# Altium schematic sheet Test Power Module Schematic.SchDoc
size A4; SheetNumber: 1; SheetTotal: 1
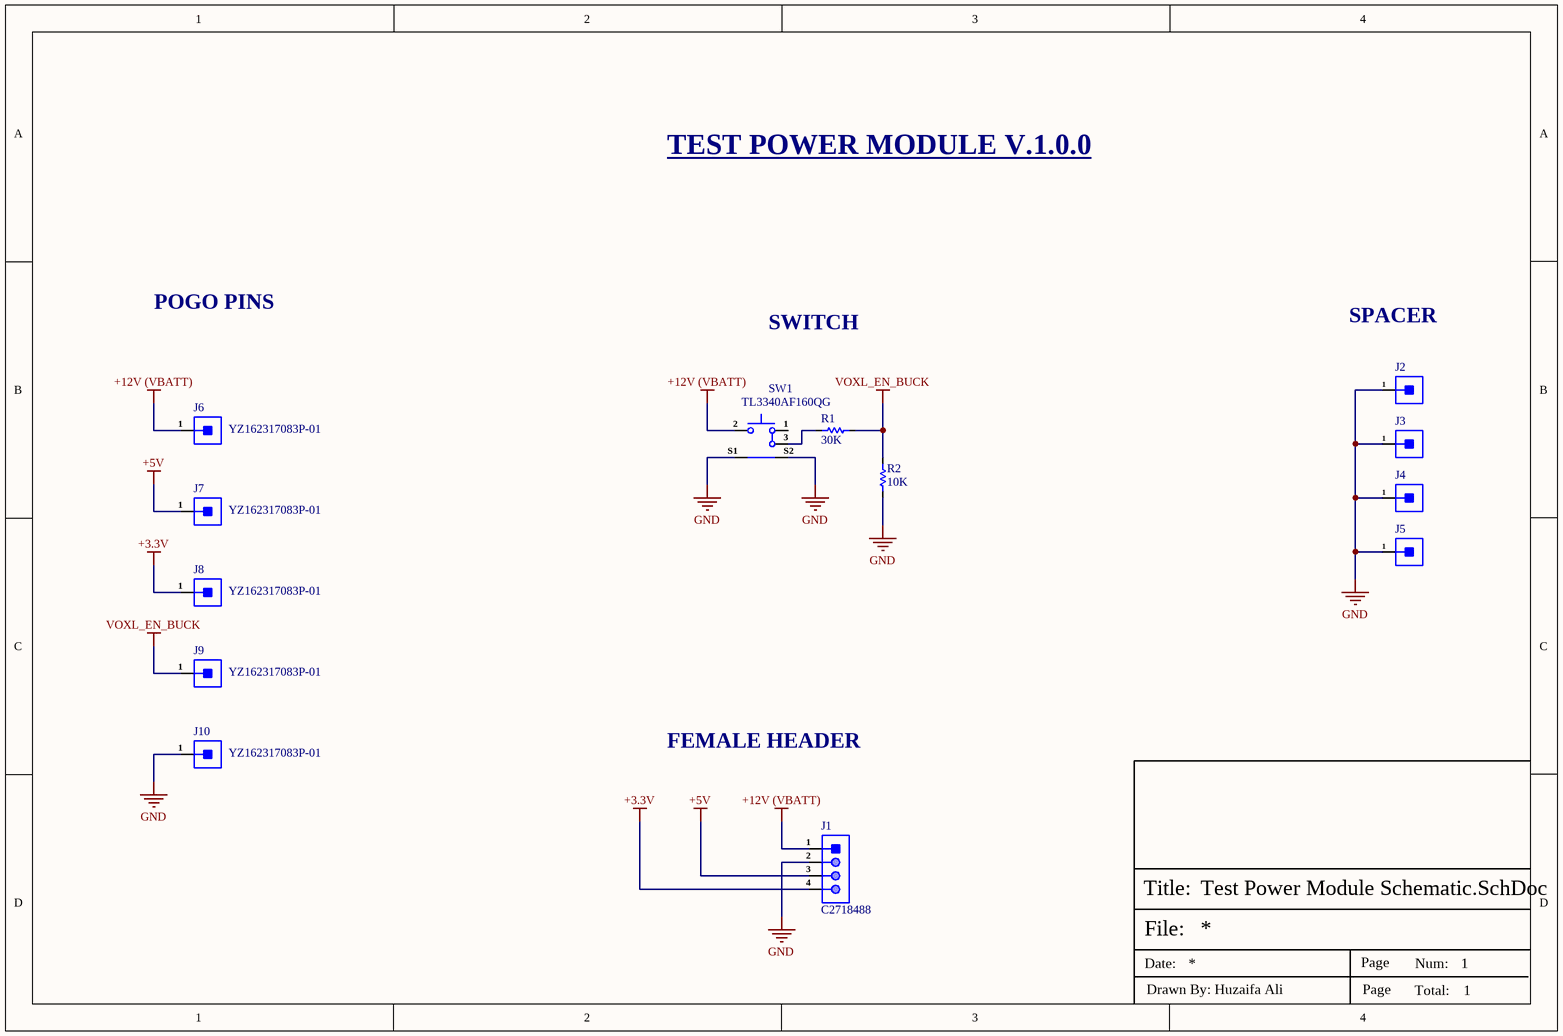
[diagram p0: Test Power Module Schematic.SchDoc]

## Parts
J1  C2718488  [HDR1X4 Female]
J2  9774050151R  [Spacer]  (value not drawn)
J3  9774050151R  [Spacer]  (value not drawn)
J4  9774050151R  [Spacer]  (value not drawn)
J5  9774050151R  [Spacer]  (value not drawn)
J6  YZ162317083P-01  [YZ162317083P-01]
J7  YZ162317083P-01  [YZ162317083P-01]
J8  YZ162317083P-01  [YZ162317083P-01]
J9  YZ162317083P-01  [YZ162317083P-01]
J10  YZ162317083P-01  [YZ162317083P-01]
R1  30K  [Res-0603]
R2  10K  [Res-0603]
SW1  TL3340AF160QG  [TL3340AF160QG]

## Nets
+3.3V: J1.4 J8.1
+5V: J1.3 J7.1
+12V (VBATT): J1.1 J6.1 SW1.2
GND: J1.2 J2.1 J3.1 J4.1 J5.1 J10.1 R2.1 SW1.S1 SW1.S2
VOXL_EN_BUCK: J9.1 R1.1 R2.2
NetR1_2: R1.2 SW1.3

Not connected (* = marked no-connect by the designer): SW1 1

## Notes on the sheet
- TEST POWER MODULE V.1.0.0
- POGO PINS
- SWITCH
- SPACER
- FEMALE HEADER
- File:
- Title:
- Date:
- Page
- Num:
- Total:
- Drawn By: Huzaifa Ali

## Library data of the parts
J1 = C2718488: 2.54mm Plugin 3A bronze -40℃~+105℃ Straight 1x4P Top 4 Square Holes Plugin,P=2.54mm Female Headers ROHS; Manufacturer: BOOMELE; Item Type: Header; Manufacturer Part Number: C2718488; Package: Plugin,P=2.54mm; LCSC Part Number: C2718488; ComponentLink1Description: LCSC; ComponentLink1URL: https://www.lcsc.com/product-detail/Female-Headers_BOOMELE-Boom-Precision-Elec-C2718488_C2718488.html
J2-J5 = 9774050151R: Spacer Material: Steel Mounting: SMT Series: WA-SMSI Thread D: M2.5; Manufacturer: Wurth Electronics; Plating: Tin; Threaded/Unthreaded: Threaded; Outside Diameter: 0.201inch; Supplier: Digikey; Supplier Part Number: 732-7095-1-ND; Manufacturer Part Number: 9774050151R; RoHS: Yes; Category: Spacers, Standoffs; Stock: 39400; Pricing: 1=1.16, 10=1.098, 50=0.979, 100=0.895 (USD); Material: Steel; Min Operating Temperature: -55°C; Max Operating Temperature: 150°C; Series: WA-SMSI; Packaging: 10Packaging; Length: 0.252inch; Height: 5.1mm; Reach SVHC Compliant: Unknown; ComponentLink1URL: http://www.farnell.com/datasheets/1960373.pdf?src-supplier=Farnell; ComponentLink1Description: http://www.farnell.com/datasheets/1960373.pdf?src-supplier=Farnell; ComponentLink2URL: http://www.mouser.com/ds/2/445/9774050151R-611428.pdf?src-supplier=Mouser; ComponentLink2Description: http://www.mouser.com/ds/2/445/9774050151R-611428.pdf?src-supplier=Mouser; ComponentLink3URL: https://media.digikey.com/pdf/Data%20Sheets/Wurth%20Electronics%20PDFs/WA-SMSx_Performance_Flyer.pdf?src-supplier=Digikey; ComponentLink3Description: https://media.digikey.com/pdf/Data%20Sheets/Wurth%20Electronics%20PDFs/WA-SMSx_Performance_Flyer.pdf?src-supplier=Digikey; ComponentLink4URL: http://www.farnell.com/datasheets/1960373.pdf?src-supplier=Element14; ComponentLink4Description: http://www.farnell.com/datasheets/1960373.pdf?src-supplier=Element14; ComponentLink5URL: https://datasheet.octopart.com/9774050151R-W%C3%BCrth-Elektronik-datasheet-48588545.pdf?src-supplier=Element14; ComponentLink5Description: https://datasheet.octopart.com/9774050151R-W%C3%BCrth-Elektronik-datasheet-48588545.pdf?src-supplier=Element14; ComponentLink6URL: http://www.farnell.com/datasheets/1960373.pdf?src-supplier=Newark; ComponentLink6Description: http://www.farnell.com/datasheets/1960373.pdf?src-supplier=Newark; ComponentLink7URL: https://katalog.we-online.de/em/datasheet/9774050151R.pdf?src-supplier=Digikey; ComponentLink7Description: https://katalog.we-online.de/em/datasheet/9774050151R.pdf?src-supplier=Digikey; Item Type: Spacer
J6-J10 = YZ162317083P-01: Brass 12V -40℃~+85℃ 单PINBit 弹簧顶针(POGO PIN) 8.3mm 50mΩ 10000次 4.28mm 2A Gold - Pogo Pin Spring Probe Connector ROHS; Manufacturer: Xinyangze; Manufacturer Part Number: YZ162317083P-01; Package: -; LCSC Part Number: C5157268; Item Type: Pogo Pin Spring Probe Connector; ComponentLink1Description: LCSC; ComponentLink1URL: https://www.lcsc.com/product-detail/Pogo-Pin-Spring-Probe-Connector_Xinyangze-YZ162317083P-01_C5157268.html
R1 = RC0603FR-0730KL: RES 30K OHM 1% 1/10W 0603; Supplier 1: Digi-Key; Supplier Part Number 1: 311-30.0KHRCT-ND; LCSC Part Number: C100001
R2 = RT0603BRD0710KL: RES SMD 10K OHM 0.1% 1/10W 0603; Manufacturer: Yageo; Power: 100mW; Rated Temperature: 70°C; Value: 10kR; Temperature Coefficient: 25ppm/°C; Working Voltage: 75V; Package Height: 0.45mm; Package Length: 1.6mm; Package Width: 0.8mm; Item Type: Resistor; Supplier 1: Rs; Manufacturer Part Number: RT0603BRD0710KL; RoHS: Yes; Category: Chip SMD Resistors; Stock 1: 20510; Pricing 1: 100=0.29800, 250=0.27800, 500=0.25900, 1000=0.23700 (GBP); Mounting Technology: Surface Mount; Pins: 2; Case/Package: 0603; Min Operating Temperature: -55°C; Max Operating Temperature: 155°C; Tolerance: 0.1%; Resistor Type: FIXED RESISTOR; Construction: Chip; Package Style: SMTMeter; Packaging: Tape and Reel; Technology: THIN FILM; Termination: Wraparound; Reach SVHC Compliant: Yes; RoHS Compliant: Yes; ComponentLink1URL: https://datasheet.ciiva.com:443/pdfs/VipMasterIC/IC/YAGO/YAGO-S-A0008510989/YAGO-S-A0008510989-1.pdf?src-supplier=IHS+Markit; ComponentLink1Description: https://datasheet.ciiva.com:443/pdfs/VipMasterIC/IC/YAGO/YAGO-S-A0008510989/YAGO-S-A0008510989-1.pdf?src-supplier=IHS+Markit; ComponentLink2URL: https://datasheet.ciiva.com/5624/pyu-rt-1-to-0-05-rohs-l-4-5624351.pdf?src-supplier=Mouser; ComponentLink2Description: https://datasheet.ciiva.com/5624/pyu-rt-1-to-0-05-rohs-l-4-5624351.pdf?src-supplier=Mouser; ComponentLink3URL: https://datasheet.ciiva.com/29721/pyu-rt-1-to-0-05-rohs-l-4-29721177.pdf?src-supplier=Digi-Key; ComponentLink3Description: https://datasheet.ciiva.com/29721/pyu-rt-1-to-0-05-rohs-l-4-29721177.pdf?src-supplier=Digi-Key; Supplier Part Number 1: 1991391P; LCSC Part Number: C95204
SW1 = TL3340AF160QG: SWITCH TACTILE SPST-NO 0.05A 12V; Manufacturer: E-Switch; Mechanical Life: 100000Cycles; Actuator Material: Polyphthalamide; Contact Current Rating: 50mA; Number of Positions: 2NUMBER; Operating Force: 160gf; Throw Configuration: SPST; Contact Resistance: 500mR; Illumination Type: Non-Illuminated,Illuminated; Switch Travel: 0.2mm; Switch Function: Off-Mom; Actuator Type: Standard; Actuator Length: 0.85mm; Item Type: Tactile Switch; Supplier: Digikey; Supplier Part Number: EG4627CT-ND; Manufacturer Part Number: TL3340AF160QG; RoHS: Yes; Category: Tactile Switches; Stock: 110635; Pricing: 1=0.54, 10=0.521, 25=0.5016, 100=0.434, 250=0.39548, 500=0.36652, 1000=0.32795 (USD); Mounting Technology: Surface Mount; Case/Package: SMD/SMT; Contact Material: Stainless Steel,Silver; Contact Plating: Stainless Steel,Silver; Color: White; Housing Material: Polyphthalamide; Min Operating Temperature: -35°C; Max Operating Temperature: 85°C; Voltage Rating (DC): 12V; Package Quantity: 1; Packaging: Tape and Reel; Current Rating: 50mA; Max Voltage Rating (DC): 12V; Termination: Gull Wing; Electrical Life: 100000Cycles; Orientation: Right Angle; Series: TL3340; Height: 3.55mm; Size: 3.3mm; Reach SVHC Compliant: No; Lead Free: 5697LeadFree; RoHS Compliant: Yes; ComponentLink1URL: https://datasheet.ciiva.com/7637/tl3340-7637667.pdf?src-supplier=Element14; ComponentLink1Description: https://datasheet.ciiva.com/7637/tl3340-7637667.pdf?src-supplier=Element14; ComponentLink2URL: https://datasheet.ciiva.com/5284/tl3340-28153-5284108.pdf?src-supplier=Mouser; ComponentLink2Description: https://datasheet.ciiva.com/5284/tl3340-28153-5284108.pdf?src-supplier=Mouser; ComponentLink3URL: https://datasheet.ciiva.com/2900/p021301b-2900825.pdf?src-supplier=Digikey; ComponentLink3Description: https://datasheet.ciiva.com/2900/p021301b-2900825.pdf?src-supplier=Digikey; ComponentLink4URL: https://datasheet.ciiva.com/2900/p021301b-2900826.pdf?src-supplier=Digikey; ComponentLink4Description: https://datasheet.ciiva.com/2900/p021301b-2900826.pdf?src-supplier=Digikey; ComponentLink5URL: https://datasheet.ciiva.com/2900/p021301b-2900827.pdf?src-supplier=Digikey; ComponentLink5Description: https://datasheet.ciiva.com/2900/p021301b-2900827.pdf?src-supplier=Digikey; LCSC Part Number: C2886925